# Altium schematic sheet Controller-Sheet.SchDoc
size A4; SheetNumber: 2; SheetTotal: 3
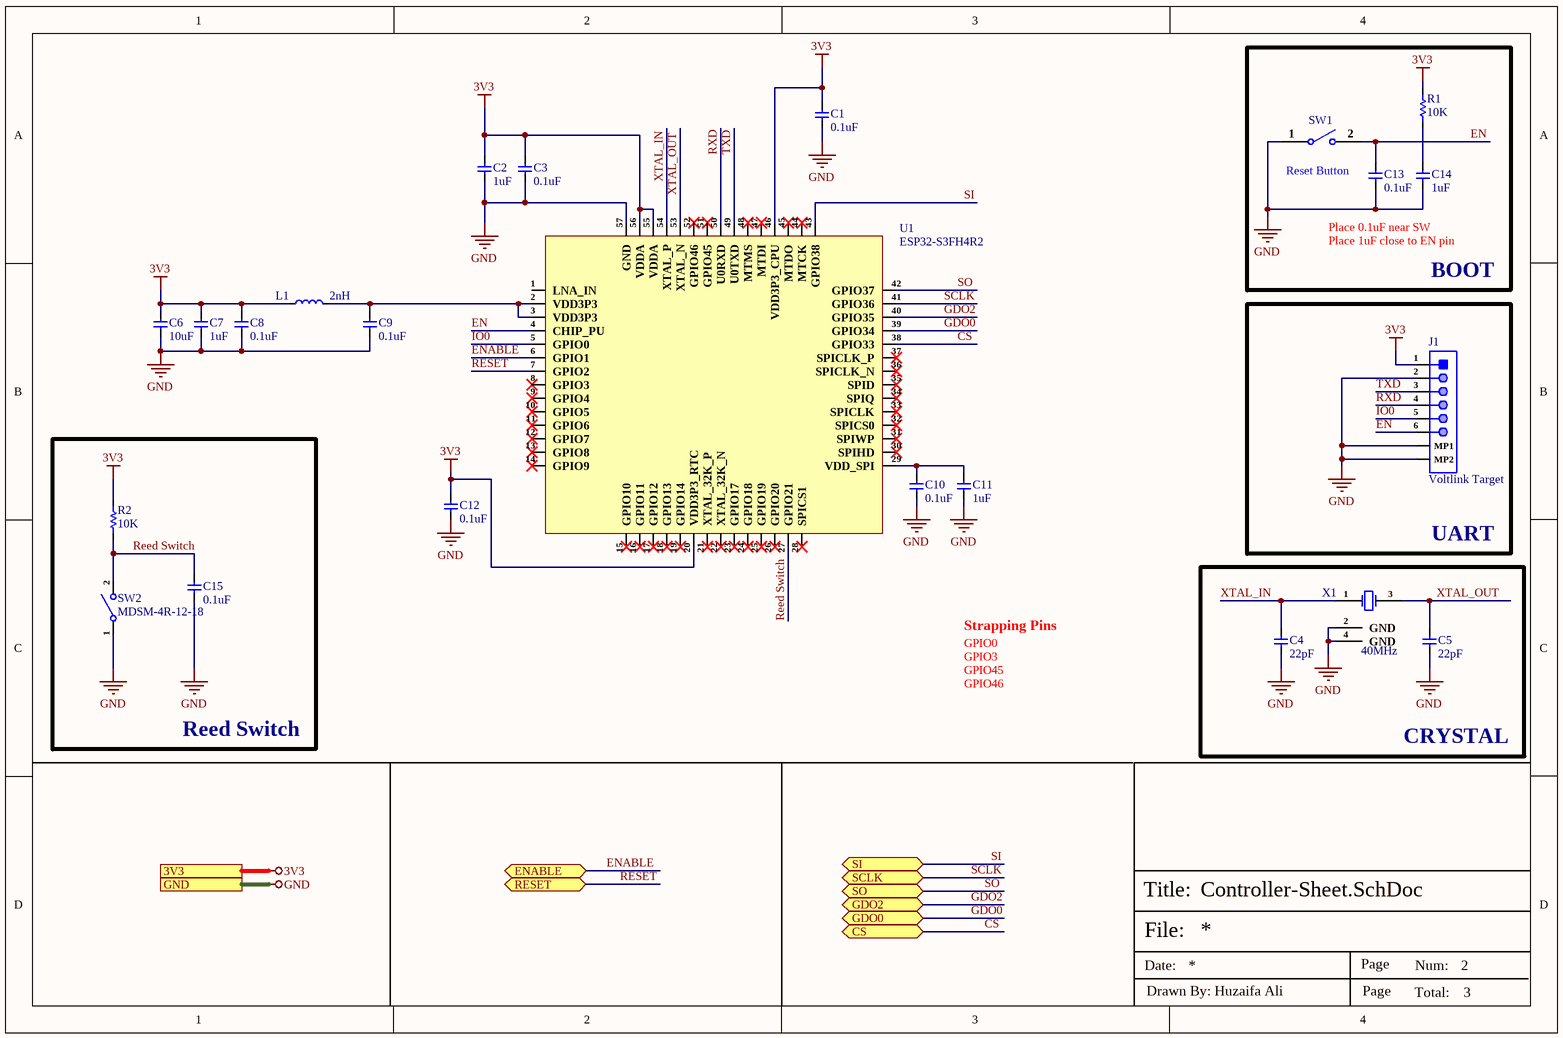
[diagram p0: Controller-Sheet.SchDoc]

## Parts
C1  0.1uF  [CAP-0201]
C2  1uF  [CAP-0201]
C3  0.1uF  [CAP-0201]
C4  22pF  [CAP-0201]
C5  22pF  [CAP-0201]
C6  10uF  [Cap-0603]
C7  1uF  [CAP-0201]
C8  0.1uF  [CAP-0201]
C9  0.1uF  [CAP-0201]
C10  0.1uF  [CAP-0201]
C11  1uF  [CAP-0201]
C12  0.1uF  [CAP-0201]
C13  0.1uF  [CAP-0201]
C14  1uF  [CAP-0201]
C15  0.1uF  [CAP-0201]
J1  Voltlink Target  [Voltlink Target]
L1  2nH  [IND-0201]
R1  10K  [Res-0201]
R2  10K  [Res-0201]
SW1  B3U-1000P  [B3U-1000P]  (value not drawn)
SW2  MDSM-4R-12-18  [MDSM-4R-12-18]
U1  ESP32-S3FH4R2  [QFNWB-56 (7×7)]
X1  40MHz  [X322540MPB4SI_]

## Blocks framed on the sheet
BOOT: C13 C14 R1 SW1
UART: J1
Reed Switch: C15 R2 SW2
CRYSTAL: C4 C5 X1

## Ports
3V3 (see Top-Sheet[2C], CC1101-Sheet[1D]), CS (bidir, see Top-Sheet[2B], CC1101-Sheet[3D]), ENABLE (bidir, see Top-Sheet[2B], CC1101-Sheet[2D]), GDO0 (bidir, see Top-Sheet[2B], CC1101-Sheet[3D]), GDO2 (bidir, see Top-Sheet[2B], CC1101-Sheet[3D]), GND (see Top-Sheet[2C], CC1101-Sheet[1D]), RESET (bidir, see Top-Sheet[2B], CC1101-Sheet[2D]), SCLK (bidir, see Top-Sheet[2B], CC1101-Sheet[3D]), SI (bidir, see Top-Sheet[2B], CC1101-Sheet[3D]), SO (bidir, see Top-Sheet[2B], CC1101-Sheet[3D])

## Nets
3V3: C1.2 C2.2 C3.2 C6.2 C7.2 C8.2 C12.2 J1.1 L1.1 R1.2 R2.2 U1.20(VDD3P3_RTC) U1.46(VDD3P3_CPU) U1.55(VDDA) U1.56(VDDA) ; port 3V3
GND: C1.1 C2.1 C3.1 C4.1 C5.1 C6.1 C7.1 C8.1 C9.1 C10.1 C11.1 C12.1 C13.1 C14.1 C15.1 J1.2 J1.MP1 J1.MP2 SW1.1 SW2.1 U1.57(GND) X1.2(GND) X1.4(GND) ; port GND
CS: U1.38(GPIO33) ; port CS
EN: C13.2 J1.6 SW1.2 U1.4(CHIP_PU)
ENABLE: U1.6(GPIO1) ; port ENABLE
GDO0: U1.39(GPIO34) ; port GDO0
GDO2: U1.40(GPIO35) ; port GDO2
IO0: J1.5 U1.5(GPIO0)
Reed Switch: C15.2 R2.1 SW2.2 U1.27(GPIO21)
RESET: U1.7(GPIO2) ; port RESET
RXD: J1.4 U1.50(U0RXD)
SCLK: U1.41(GPIO36) ; port SCLK
SI: U1.43(GPIO38) ; port SI
SO: U1.42(GPIO37) ; port SO
TXD: J1.3 U1.49(U0TXD)
XTAL_IN: C4.2 U1.54(XTAL_P) X1.1(CRYSTAL)
XTAL_OUT: C5.2 U1.53(XTAL_N) X1.3(CRYSTAL)
NetC9_2: C9.2 L1.2 U1.2(VDD3P3) U1.3(VDD3P3)
NetC10_2: C10.2 C11.2 U1.29(VDD_SPI)
NetC14_2: C14.2 R1.1

Not connected (* = marked no-connect by the designer): U1 1(LNA_IN) 8(GPIO3)* 9(GPIO4)* 10(GPIO5)* 11(GPIO6)* 12(GPIO7)* 13(GPIO8)* 14(GPIO9)* 15(GPIO10)* 16(GPIO11)* 17(GPIO12)* 18(GPIO13)* 19(GPIO14)* 21(XTAL_32K_P)* 22(XTAL_32K_N)* 23(GPIO17)* 24(GPIO18)* 25(GPIO19)* 26(GPIO20)* 28(SPICS1)* 30(SPIHD)* 31(SPIWP)* 32(SPICS0)* 33(SPICLK)* 34(SPIQ)* 35(SPID)* 36(SPICLK_N)* 37(SPICLK_P)* 44(MTCK)* 45(MTDO)* 47(MTDI)* 48(MTMS)* 51(GPIO45)* 52(GPIO46)*

## Notes on the sheet
- Reset Button
- Place 1uF close to EN pin
- Place 0.1uF near SW
- Strapping Pins
- GPIO0
  GPIO3
  GPIO45
  GPIO46
- File:
- Title:
- Date:
- Page
- Num:
- Total:
- Drawn By: Huzaifa Ali

## Library data of the parts
C1 C3 C8-C10 C12 C13 C15 = GRM033R61E104KE14D: CAP CER 0.1UF 25V X5R 0201; Manufacturer: Murata; Tolerance: 10%; Item Type: Capacitor; Material: 4241ConductorMaterial; Value: 100nF; Manufacturer Part Number: GRM033R61E104KE14D; RoHS: Yes; Category: Ceramic Capacitors; Case/Package: 0201; Case Code (Metric): 0603; Case Code (Imperial): 0201; Weight: 1.2E-05oz; Min Operating Temperature: -55°C; Max Operating Temperature: 85°C; Packaging: Tape and Reel; Voltage Rating: 25V; Dielectric: X5R; Termination: SMD/SMT; Voltage Rating (DC): 25V; Package Quantity: 15000; Series: GRM; Length: 0.024inch; Width: 0.012inch; Height: 0.3mm; Thickness: 0.013inch; Lead Free: Lead Free; RoHS Compliant: Yes; ComponentLink1URL: http://www.farnell.com/datasheets/2867843.pdf?src-supplier=Farnell; ComponentLink1Description: http://www.farnell.com/datasheets/2867843.pdf?src-supplier=Farnell; ComponentLink2URL: http://www.mouser.com/ds/2/281/c02e-2905.pdf?src-supplier=Mouser; ComponentLink2Description: http://www.mouser.com/ds/2/281/c02e-2905.pdf?src-supplier=Mouser; ComponentLink3URL: https://datasheet.octopart.com/GRM033R61E104KE14D-Murata-datasheet-22122223.pdf?src-supplier=Future+Electronics; ComponentLink3Description: https://datasheet.octopart.com/GRM033R61E104KE14D-Murata-datasheet-22122223.pdf?src-supplier=Future+Electronics; ComponentLink4URL: http://www.farnell.com/datasheets/2867843.pdf?src-supplier=Element14; ComponentLink4Description: http://www.farnell.com/datasheets/2867843.pdf?src-supplier=Element14; ComponentLink5URL: http://search.murata.co.jp/Ceramy/image/img/A01X/G101/ENG/GRM033R61E104KE14-01.pdf?src-supplier=Digi-Key; ComponentLink5Description: http://search.murata.co.jp/Ceramy/image/img/A01X/G101/ENG/GRM033R61E104KE14-01.pdf?src-supplier=Digi-Key; LCSC Part Number: C76939; Supplier: Rs; Supplier Part Number: 1852066; Stock: 14000; Pricing: 1000=0.008, 5000=0.007, 10000=0.006 (GBP); Mounting Technology: Surface Mount; ComponentLink6URL: http://www.farnell.com/datasheets/2867843.pdf?src-supplier=Newark; ComponentLink6Description: http://www.farnell.com/datasheets/2867843.pdf?src-supplier=Newark; ComponentLink7URL: https://datasheet.octopart.com/GRM033R61E104KE14D-Murata-datasheet-165579666.pdf?src-supplier=TME; ComponentLink7Description: https://datasheet.octopart.com/GRM033R61E104KE14D-Murata-datasheet-165579666.pdf?src-supplier=TME
C2 C7 C11 C14 = GRM033R61C105ME15D: CAP CER 1UF 16V X5R 0201; Manufacturer: Murata; Item Type: Capacitor; Supplier 1: Digi-Key; Manufacturer Part Number: GRM033R61C105ME15D; Stock 1: 12823; Pricing 1: 1=0.14, 10=0.098, 50=0.0554, 100=0.0459, 500=0.0322, 1000=0.02665, 2500=0.02481, 5000=0.0227 (USD); ComponentLink1URL: https://datasheet.octopart.com/GRM033R61C105ME15D-Murata-datasheet-155345049.pdf?src-supplier=Element14; ComponentLink1Description: https://datasheet.octopart.com/GRM033R61C105ME15D-Murata-datasheet-155345049.pdf?src-supplier=Element14; Supplier Part Number 1: 490-18654-1-ND; LCSC Part Number: C335102; RoHS: No; Category: Ceramic Capacitors; ComponentLink2URL: https://datasheet.octopart.com/GRM033R61C105ME15D-Murata-datasheet-165579666.pdf?src-supplier=TME; ComponentLink2Description: https://datasheet.octopart.com/GRM033R61C105ME15D-Murata-datasheet-165579666.pdf?src-supplier=TME
C4 C5 = GRM0335C1H220JA01D: CAP CER 22PF 50V C0G/NP0 0201; Manufacturer: Murata; Tolerance: 5%; Dielectric: C0G; Temperature Coefficient: 30ppm/°C; Item Type: Capacitor; Material: 4241ConductorMaterial; Manufacturer Part Number: GRM0335C1H220JA01D; RoHS: Yes; Category: Ceramic Capacitors; Mounting Technology: Surface Mount; Case/Package: 0201; Case Code (Metric): 0603; Case Code (Imperial): 0201; Min Operating Temperature: -55°C; Max Operating Temperature: 125°C; Value: 22pF; Voltage Rating: 50V; Packaging: Tape and Reel; Package Quantity: 1; Voltage Rating (DC): 50V; Termination: SMD/SMT; Voltage: 50V; Series: GRM; Length: 0.024inch; Width: 0.012inch; Height: 0.3mm; Depth: 0.3mm; Lead Free: Lead Free; RoHS Compliant: Yes; ComponentLink1URL: https://datasheet.ciiva.com/6271/partnumbering-e-01-6271146.pdf?src-supplier=Digi-Key; ComponentLink1Description: https://datasheet.ciiva.com/6271/partnumbering-e-01-6271146.pdf?src-supplier=Digi-Key; ComponentLink2URL: https://datasheet.ciiva.com/6271/partnumbering-e-01-6271143.pdf?src-supplier=Digi-Key; ComponentLink2Description: https://datasheet.ciiva.com/6271/partnumbering-e-01-6271143.pdf?src-supplier=Digi-Key; ComponentLink3URL: https://datasheet.ciiva.com/6271/partnumbering-e-01-6271149.pdf?src-supplier=Digi-Key; ComponentLink3Description: https://datasheet.ciiva.com/6271/partnumbering-e-01-6271149.pdf?src-supplier=Digi-Key; LCSC Part Number: C76924; Supplier: Rs; Supplier Part Number: 8202728; Stock: 9500; Pricing: 500=0.004, 5000=0.003, 12500=0.002, 50000=0.002 (GBP)
C6 = GRM188R6YA106MA73D: 10uF 35V X5R 20% Pad SMD 0603; Manufacturer: Murata; Supplier 1: Arrow Electronics; Manufacturer Part Number: GRM188R6YA106MA73D; RoHS: Yes; Category: Ceramic Capacitors; Stock 1: 37601; Pricing 1: 1=0.36650, 10=0.23380, 25=0.23160, 100=0.15050, 250=0.14890, 500=0.10700, 1000=0.09270, 3000=0.08640, 6000=0.07720, 15000=0.07140, 30000=0.05840 (USD); Mount: Surface Mount; Case/Package: 0603; Case Code (Metric): 1608; Case Code (Imperial): 0603; Min Operating Temperature: -55°C; Max Operating Temperature: 85°C; Packaging: Tape and Reel; Capacitance: 10uF; Voltage Rating: 35V; Tolerance: 20%; Voltage Rating (DC): 35V; Dielectric: X5R; Length: 0.063inch; Width: 0.031inch; Thickness: 0.039inch; RoHS Compliant: Yes; ComponentLink1URL: http://search.murata.co.jp/Ceramy/image/img/A01X/G101/ENG/GRM188R6YA106MA73-01.pdf?src-supplier=Future+Electronics; ComponentLink1Description: http://search.murata.co.jp/Ceramy/image/img/A01X/G101/ENG/GRM188R6YA106MA73-01.pdf?src-supplier=Future+Electronics; ComponentLink2URL: http://search.murata.co.jp/Ceramy/image/img/A01X/G101/ENG/GRM188R6YA106MA73-01.pdf?src-supplier=Digi-Key; ComponentLink2Description: http://search.murata.co.jp/Ceramy/image/img/A01X/G101/ENG/GRM188R6YA106MA73-01.pdf?src-supplier=Digi-Key; ComponentLink3URL: https://www.murata.com/~/media/webrenewal/support/library/catalog/products/capacitor/mlcc/c02e.ashx?la=en-us&src-supplier=Digi-Key; ComponentLink3Description: https://www.murata.com/~/media/webrenewal/support/library/catalog/products/capacitor/mlcc/c02e.ashx?la=en-us&src-supplier=Digi-Key; ComponentLink4URL: http://search.murata.co.jp/Ceramy/image/img/A01X/G101/ENG/GRM188R6YA106MA73-01.pdf?src-supplier=Mouser; ComponentLink4Description: http://search.murata.co.jp/Ceramy/image/img/A01X/G101/ENG/GRM188R6YA106MA73-01.pdf?src-supplier=Mouser; ComponentLink5URL: http://search.murata.co.jp/Ceramy/image/img/A01X/G101/ENG/GRM188R6YA106MA73-01.pdf?src-supplier=TTI; ComponentLink5Description: http://search.murata.co.jp/Ceramy/image/img/A01X/G101/ENG/GRM188R6YA106MA73-01.pdf?src-supplier=TTI; Supplier Part Number 1: GRM188R6YA106MA73D; LCSC Part Number: C194427
J1 = C145963: 1x6P SH 1 1mm 6 SMD,P=1mm Wire To Board / Wire To Wire Connector ROHS; Manufacturer: BOOMELE; Manufacturer Part Number: C145963; Package: SMD,P=1mm; LCSC Part Number: C145963; Item Type: Connector; ComponentLink1Description: LCSC; ComponentLink1URL: https://www.lcsc.com/product-detail/Wire-To-Board-Wire-To-Wire-Connector_BOOMELE-Boom-Precision-Elec-C145963_C145963.html
L1 = MLG0603P2N0CT000: FIXED IND 2NH 600MA 100 MOHM SMD; Manufacturer: TDK; Item Type: Inductor; Core Material: Non-Magnetic; Shielding: Unshielded; DC Resistance (DCR): 100mR; Self Resonant Frequency: 8.5GHz; Test Frequency: 500MHz; Supplier: Digi-Key; Supplier Part Number: 445-172431-1-ND; Manufacturer Part Number: MLG0603P2N0CT000; RoHS: Yes; Category: Fixed Inductors; Stock: 23499; Pricing: 1=0.13, 10=0.118, 25=0.1, 50=0.0882, 100=0.0808, 250=0.07352, 500=0.06908, 1000=0.05292, 2500=0.04998 (USD); ComponentLink1URL: https://datasheet.ciiva.com/41860/inductor-commercial-high-frequency-mlg-qp-en-41860968.pdf?src-supplier=Digi-Key; ComponentLink1Description: https://datasheet.ciiva.com/41860/inductor-commercial-high-frequency-mlg-qp-en-41860968.pdf?src-supplier=Digi-Key; LCSC Part Number: C531323; Mounting Technology: Surface Mount; Case/Package: 0201; Case Code (Metric): 0603; Case Code (Imperial): 0201; Min Operating Temperature: -55°C; Max Operating Temperature: 125°C; Package Quantity: 15000; Packaging: Cut Tape; Current Rating: 600mA; Value: 2nH; Series: MLG-P; Length: 0.024inch; Width: 0.012inch; Height - Seated (Max): 0.013inch; RoHS Compliant: Yes
R1 R2 = RC0201FR-0710KL: RES SMD 10K OHM 1% 1/20W 0201; Manufacturer: Yageo; Item Type: Resistor; Manufacturer Part Number: RC0201FR-0710KL; Package: 0201; ComponentLink7Description: LCSC; ComponentLink7URL: https://www.lcsc.com/product-detail/Chip-Resistor-Surface-Mount_YAGEO-RC0201FR-0710KL_C106225.html; LCSC Part Number: C106225
SW1 = B3U-1000P: SWITCH TACTILE SPST-NO 0.05A 12V; Manufacturer: Omron; Mechanical Life: 200000Cycles; Operating Force: 1.5N; Throw Configuration: SPST; Current Rating: 50mA; Contact Resistance: 100mR; Illumination Type: Non-Illuminated,Illuminated; Switch Travel: 0.15mm; Switch Function: Off-Mom; Actuator Type: Standard; Actuator Length: 0.4mm; Ratings: Dust Proof,IP40; ComponentLink1URL: http://www.farnell.com/datasheets/60838.pdf?src-supplier=Farnell; ComponentLink1Description: http://www.farnell.com/datasheets/60838.pdf?src-supplier=Farnell; ComponentLink2URL: http://www.farnell.com/datasheets/60838.pdf?src-supplier=Element14; ComponentLink2Description: http://www.farnell.com/datasheets/60838.pdf?src-supplier=Element14; ComponentLink3URL: https://omronfs.omron.com/en_US/ecb/products/pdf/en-b3u.pdf?src-supplier=Digi-Key; ComponentLink3Description: https://omronfs.omron.com/en_US/ecb/products/pdf/en-b3u.pdf?src-supplier=Digi-Key; ComponentLink4URL: http://www.omron.com/ecb/products/pdf/en-b3u.pdf?src-supplier=Digi-Key; ComponentLink4Description: http://www.omron.com/ecb/products/pdf/en-b3u.pdf?src-supplier=Digi-Key; ComponentLink5URL: https://www.distrelec.biz/Web/Downloads/he/et/B3U_eng_datasheet.pdf?mime=application%2Fpdf&src-supplier=Distrelec; ComponentLink5Description: https://www.distrelec.biz/Web/Downloads/he/et/B3U_eng_datasheet.pdf?mime=application%2Fpdf&src-supplier=Distrelec; ComponentLink6URL: http://www.onlinecomponents.com/productFiles/mf-OM/en-b3u.pdf?src-supplier=Onlinecomponents.com; ComponentLink6Description: http://www.onlinecomponents.com/productFiles/mf-OM/en-b3u.pdf?src-supplier=Onlinecomponents.com; Supplier 1: Digi-Key; Manufacturer Part Number: B3U-1000P; Stock 1: 116454; Pricing 1: 1=1, 10=0.961, 25=0.9064, 50=0.7976, 100=0.7251, 250=0.68888, 500=0.67074, 1000=0.52571 (USD); Mount: Surface Mount; Weight: 0.000776oz; Contact Material: Silver; Min Operating Temperature: -25°C; Max Operating Temperature: 70°C; Packaging: Tape and Reel; Voltage Rating (DC): 12V; Package Quantity: 1; Max Current Rating: 50mA; Termination: SMD/SMT; Orientation: Straight; Max Voltage Rating (DC): 12V; Electrical Life: 200000Cycles; Insulation Resistance: 100MR; Contact Current Rating: 50mA; Length: 4mm; Height: 1.2mm; Depth: 2.5mm; Width: 3mm; REACH SVHC: Unknown; Lead Free: Lead Free; ComponentLink7URL: https://www.verical.com/server-webapp/html/getDatasheet?partID=552554&src-supplier=Verical; ComponentLink7Description: https://www.verical.com/server-webapp/html/getDatasheet?partID=552554&src-supplier=Verical; ComponentLink8URL: http://www.farnell.com/datasheets/1685550.pdf?src-supplier=Element14; ComponentLink8Description: http://www.farnell.com/datasheets/1685550.pdf?src-supplier=Element14; ComponentLink9URL: http://www.farnell.com/datasheets/2610940.pdf?src-supplier=Farnell; ComponentLink9Description: http://www.farnell.com/datasheets/2610940.pdf?src-supplier=Farnell; ComponentLink10URL: https://www.alliedelec.com/m/d/4c8a9ef82804fc3c241a13c1e298fd73.pdf?src-supplier=Allied+Electronics; ComponentLink10Description: https://www.alliedelec.com/m/d/4c8a9ef82804fc3c241a13c1e298fd73.pdf?src-supplier=Allied+Electronics; Supplier Part Number 1: SW1020DKR-ND; LCSC Part Number: C231329; Item Type: Switch
SW2 = MDSM-4R-12-18: SWITCH REED SPST-NO 350MA 140V; Manufacturer: Littelfuse; Contact Current Rating: 500mA; Supplier: Digi-Key; Supplier Part Number: HE151CT-ND; Manufacturer Part Number: MDSM-4R-12-18; RoHS: Yes; Category: Switches; Stock: 229031; Pricing: 1=0.97, 10=0.932, 25=0.8712, 100=0.7565, 250=0.6884, 500=0.6603 (USD); Pins: 2NUMBER; Height: 2.84mm; ComponentLink1URL: https://datasheet.ciiva.com/26852/getdatasheetpartid-422080-26852456.pdf?src-supplier=Verical; ComponentLink1Description: https://datasheet.ciiva.com/26852/getdatasheetpartid-422080-26852456.pdf?src-supplier=Verical; ComponentLink2URL: https://datasheet.ciiva.com/16451/mdsm-4-16451549.pdf?src-supplier=Future+Electronics; ComponentLink2Description: https://datasheet.ciiva.com/16451/mdsm-4-16451549.pdf?src-supplier=Future+Electronics; ComponentLink3URL: https://datasheet.ciiva.com/29124/mdsm-4r-29124540.pdf?src-supplier=Digi-Key; ComponentLink3Description: https://datasheet.ciiva.com/29124/mdsm-4r-29124540.pdf?src-supplier=Digi-Key; ComponentLink4URL: https://datasheet.ciiva.com/29124/mdsm-4r-29124541.pdf?src-supplier=Digi-Key; ComponentLink4Description: https://datasheet.ciiva.com/29124/mdsm-4r-29124541.pdf?src-supplier=Digi-Key; ComponentLink5URL: https://datasheet.ciiva.com/29124/mdsm-4r-29124542.pdf?src-supplier=Digi-Key; ComponentLink5Description: https://datasheet.ciiva.com/29124/mdsm-4r-29124542.pdf?src-supplier=Digi-Key
U1 = ESP32-S3FH4R2: 21dBm ESP32-S3R8 2.4GHz SMD WiFi Modules ROHS; Manufacturer: Espressif Systems; Item Type: IC; Supplier: Mouser; Supplier Part Number: 356-ESP32-S3FH4R2; Manufacturer Part Number: ESP32-S3FH4R2; RoHS: No; Stock: 2650; Pricing: 1=2.32, 10=2.32, 50=2.32, 100=2.32, 1000=2.32, 10000=2.32 (USD); LCSC Part Number: C3013940; ComponentLink1Description: LCSC; ComponentLink1URL: https://www.lcsc.com/product-detail/WiFi-Modules_Espressif-Systems-ESP32-S3FH4R2_C3013940.html
X1 = X322540MPB4SI: 40MHz SMD Crystal Resonator 15pF SMD3225-4P Crystals ROHS; Manufacturer: Yangxing Tech; Manufacturer Part Number: X322540MPB4SI; Value: 40MHZ; LCSC Part Number: C9010; ComponentLink1Description: LCSC; ComponentLink1URL: https://www.lcsc.com/product-detail/Crystals_Yangxing-Tech-X322540MPB4SI_C9010.html; Item Type: Crystal